# Altium schematic sheet SFY_ADA_4G_01_ESP.SchDoc: ESP32
size 297 x 209 mm
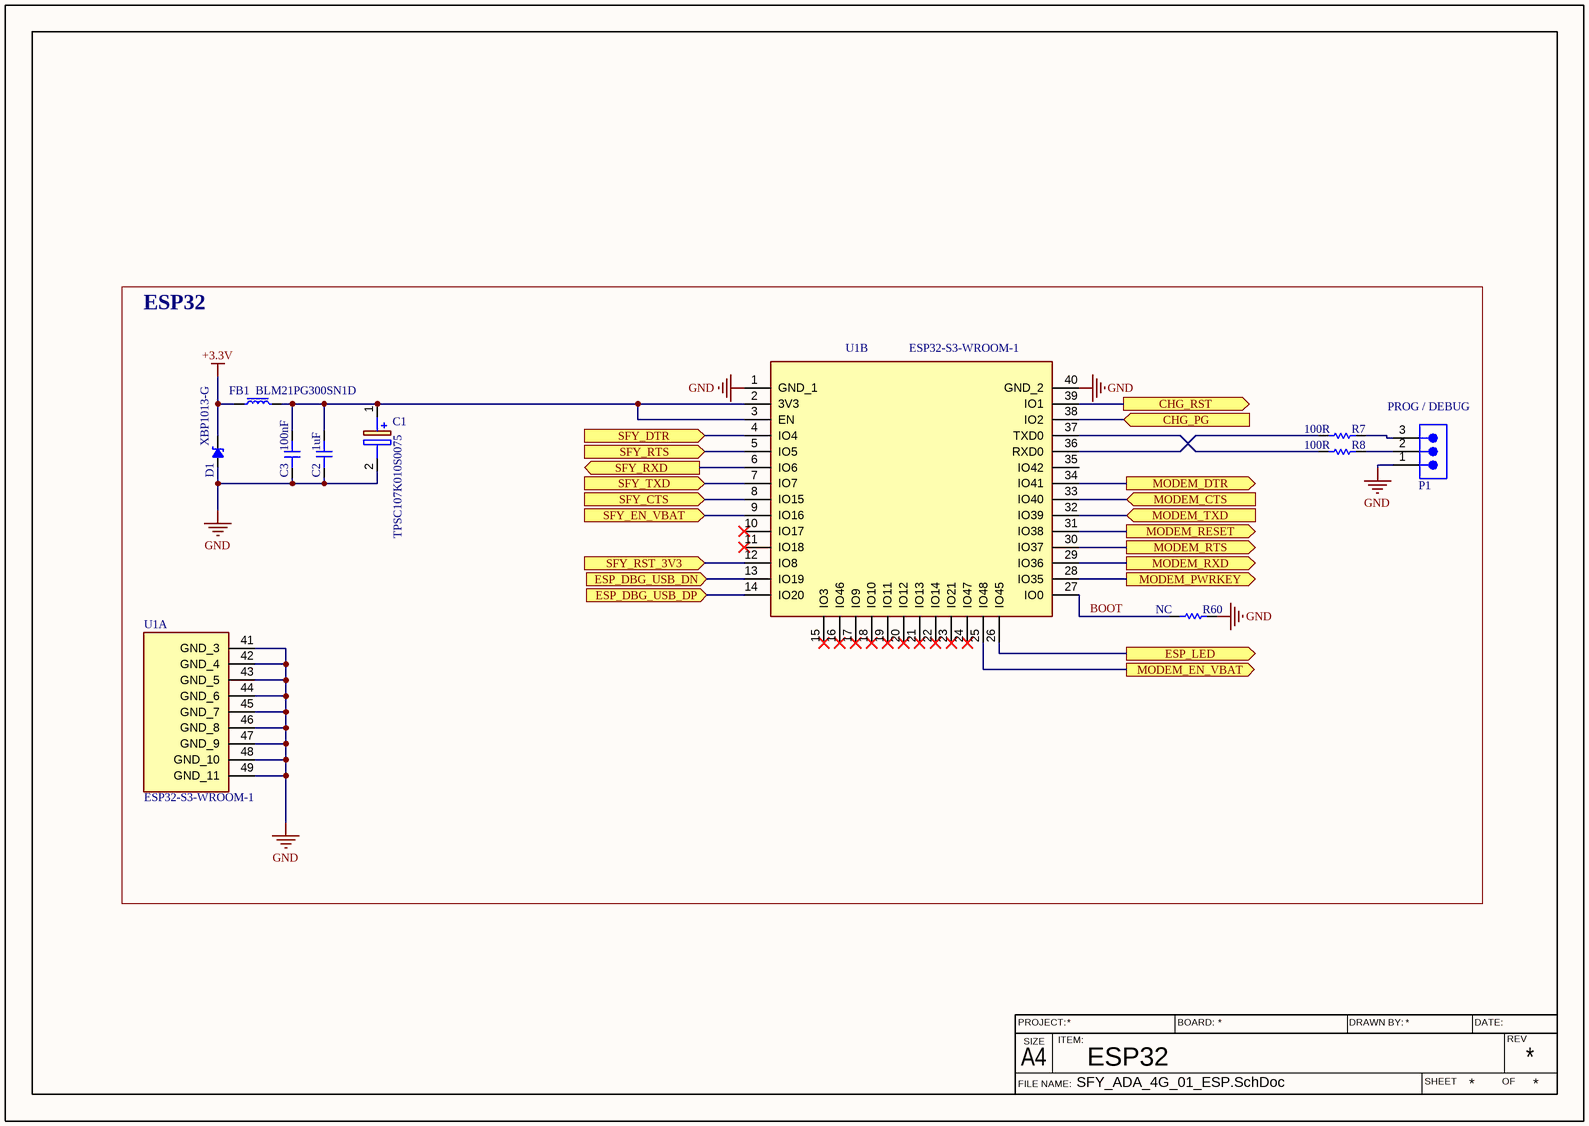
[diagram p0: SFY_ADA_4G_01_ESP.SchDoc]

## Parts
C1  TPSC107K010S0075  [CAPPM6032X280N]
C2  1uF  [C_0603_H_0.8_M]
C3  100nF  [C_0603_H_0.8_M]
D1  XBP1013-G  [SOD-323-2]
FB1  BLM21PG300SN1D  [F_0805_H_1.1_M]
P1  61300311121  [61300311121]  (value not drawn)
R7  100R  [R_0603_H_0.45_M]
R8  100R  [R_0603_H_0.45_M]
R60  NC  [R_0603_H_0.45_M]
U1  ESP32-S3-WROOM-1  [ESP32-S3-WROOM-1U]  (parts A,B of 2)

## Ports
CHG_PG (in, see 00_CHG_POWER[1C]), CHG_RST (out, see 00_CHG_POWER[3D]), ESP_DBG_USB_DN (in, see 03_MODEM_2[2D]), ESP_DBG_USB_DP (in, see 03_MODEM_2[2D]), ESP_LED (out, see 02_MODEM_1[2D]), MODEM_CTS (in, see 03_MODEM_2[4D]), MODEM_DTR (out, see 03_MODEM_2[4A]), MODEM_EN_VBAT (out, see 00_CHG_POWER[5C]), MODEM_PWRKEY (out, see 03_MODEM_2[1A]), MODEM_RESET (out, see 03_MODEM_2[1B]), MODEM_RTS (out, see 03_MODEM_2[4B]), MODEM_RXD (out, see 03_MODEM_2[4C]), MODEM_TXD (in, see 03_MODEM_2[4C]), SFY_CTS (in, see 00_CHG_POWER[2A]), SFY_DTR (in, see 00_CHG_POWER[1A]), SFY_EN_VBAT (in, see 00_CHG_POWER[1A]), SFY_RST_3V3 (in, see 00_CHG_POWER[2A]), SFY_RTS (in, see 00_CHG_POWER[1A]), SFY_RXD (out, see 00_CHG_POWER[1A]), SFY_TXD (in, see 00_CHG_POWER[1B])

## Nets
+3.3V: D1.2(K) FB1.1
GND: C1.2(-) C2.1 C3.1 D1.1(A) P1.1 R60.2 U1.1(GND_1) U1.40(GND_2) U1.41(GND_3) U1.42(GND_4) U1.43(GND_5) U1.44(GND_6) U1.45(GND_7) U1.46(GND_8) U1.47(GND_9) U1.48(GND_10) U1.49(GND_11)
BOOT: R60.1 U1.27(IO0)
CHG_PG: U1.38(IO2) ; port CHG_PG
CHG_RST: U1.39(IO1) ; port CHG_RST
ESP_DBG_USB_DN: U1.13(IO19) ; port ESP_DBG_USB_DN
ESP_DBG_USB_DP: U1.14(IO20) ; port ESP_DBG_USB_DP
ESP_LED: U1.26(IO45) ; port ESP_LED
MODEM_CTS: U1.33(IO40) ; port MODEM_CTS
MODEM_DTR: U1.34(IO41) ; port MODEM_DTR
MODEM_EN_VBAT: U1.25(IO48) ; port MODEM_EN_VBAT
MODEM_PWRKEY: U1.28(IO35) ; port MODEM_PWRKEY
MODEM_RESET: U1.31(IO38) ; port MODEM_RESET
MODEM_RTS: U1.30(IO37) ; port MODEM_RTS
MODEM_RXD: U1.29(IO36) ; port MODEM_RXD
MODEM_TXD: U1.32(IO39) ; port MODEM_TXD
SFY_CTS: U1.8(IO15) ; port SFY_CTS
SFY_DTR: U1.4(IO4) ; port SFY_DTR
SFY_EN_VBAT: U1.9(IO16) ; port SFY_EN_VBAT
SFY_RST_3V3: U1.12(IO8) ; port SFY_RST_3V3
SFY_RTS: U1.5(IO5) ; port SFY_RTS
SFY_RXD: U1.6(IO6) ; port SFY_RXD
SFY_TXD: U1.7(IO7) ; port SFY_TXD
NetC1_1: C1.1(+) C2.2 C3.2 FB1.2 U1.2(3V3) U1.3(EN)
NetP1_2: P1.2 R8.2
NetP1_3: P1.3 R7.2
NetR7_1: R7.1 U1.36(RXD0)
NetR8_1: R8.1 U1.37(TXD0)

Not connected (* = marked no-connect by the designer): U1 10(IO17)* 11(IO18)* 15(IO3)* 16(IO46)* 17(IO9)* 18(IO10)* 19(IO11)* 20(IO12)* 21(IO13)* 22(IO14)* 23(IO21)* 24(IO47)* 35(IO42)

## Notes on the sheet
- ESP32
- PROG / DEBUG
- FILE NAME:
- PROJECT:
- A4
- SIZE
- ITEM:
- BOARD:
- DRAWN BY:
- SHEET
- DATE:
- OF
- REV

## Library data of the parts
C1 = TPSC107K010S0075: Capacitor Polarised; Manufacturer_Name: Kyocera AVX; Datasheet Link: https://datasheets.kyocera-avx.com/TPS.pdf; Height: 2.8mm; Manufacturer_Part_Number: TPSC107K010S0075; Mouser Part Number: 581-TPSC107K010S0075; Mouser Price/Stock: https://www.mouser.co.uk/ProductDetail/KYOCERA-AVX/TPSC107K010S0075?qs=06QaI1AeGGYXIlSOad5TiA%3D%3D
C2 C3 = C: TYPE / TOLERANCE / VOLTAGE / PACKAGE; Symbol_Valid: 20260706; Manufacturer_Name: *; Manufacturer_Ref: *; Keolabs_ref: *
D1 = D_TVS_UNIDIR: 5V; Symbol_Valid: 20260706; Manufacturer_Name: *; Manufacturer_Ref: *; Keolabs_Ref: *
FB1 = FB: Symbol_Valid: 20260706; Manufacturer_Name: *; Manufacturer_Ref: *; Keolabs_Ref: *
P1 = 61300311121: WR-PHD Pin Header, THT, Vertical, pitch 2.54mm, 1 Row, 3P; Manufacturer: Wurth Elektronik; Contact Resistance: 20mΩ; Rated Current: 3A; Working Voltage: 250V; Withstanding Voltage: 500V; ComponentLink1Description: Website Link; ComponentLink1URL: https://www.we-online.com/redexpert/article/61300311121?ad; ComponentLink2Description: Datasheet Link; ComponentLink2URL: https://www.we-online.com/redexpert/spec/61300311121?ad; Manufacturer Part Number: 61300311121; Category: Board-to-Board Connectors; Match Code: WR-PHD; Mount: Through Hole; Operating Temperature Max: 105°C; Operating Temperature Min: -40°C; Packaging: Bag; Gender: Pin Header; Number of Pins: 3; Number of Rows: 1; Orientation: Vertical; Pitch: 2.54mm
R7 R8 R60 = R: TOLERANCE / POWER / VOLTAGE / PACKAGE; Symbol_Valid: 20260706; Manufacturer_Name: *; Manufacturer_Ref: *; Keolabs_Ref: *
U1 = ESP32-S3-WROOM-1: Integrated Circuit; Manufacturer_Name: Espressif Systems; Manufacturer_Part_Number: ESP32-WROOM-32UE(M113EH2800UH3Q0); Datasheet Link: https://www.mouser.co.uk/datasheet/2/891/esp32_wroom_32e_esp32_wroom_32ue_datasheet_en-1855879.pdf; Height: 3.35mm; Mouser Part Number: N/A; Mouser Price/Stock: https://www.mouser.co.uk/ProductDetail/Espressif-Systems/ESP32-WROOM-32UEM113EH2800UH3Q0?qs=vHuUswq2%252BswmjMZOJoYkgw%3D%3D